# Altium schematic sheet Top_Sheet.SchDoc
size A4; DocumentNumber: 1; SheetNumber: 1; SheetTotal: 5
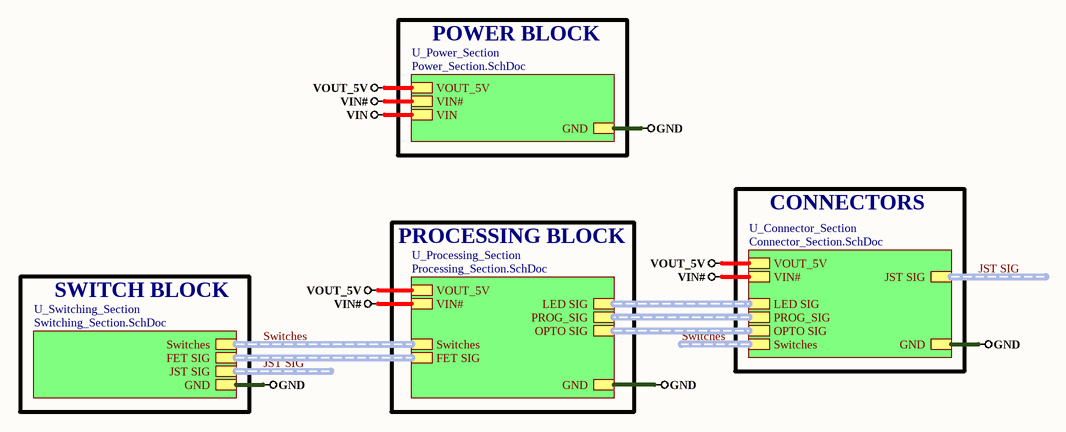
[diagram p0: Top_Sheet.SchDoc]

## Sub-sheets
U_Connector_Section = Connector_Section.SchDoc: VOUT_5V, GND, VIN#, PROG_SIG (harness PROG_SIG), LED SIG (harness LED SIG), Switches (harness Switches), OPTO SIG (harness OPTO SIG), JST SIG (harness JST SIG)
U_Power_Section = Power_Section.SchDoc: VOUT_5V, GND, VIN#, VIN
U_Processing_Section = Processing_Section.SchDoc: Switches (harness Switches), LED SIG (harness LED SIG), PROG_SIG (harness PROG_SIG), VOUT_5V, VIN#, FET SIG (harness FET SIG), OPTO SIG (harness OPTO SIG), GND
U_Switching_Section = Switching_Section.SchDoc: FET SIG (harness FET SIG), Switches (harness Switches), GND, JST SIG (harness JST SIG)

## Nets
GND: sheet U_Connector_Section/GND, sheet U_Processing_Section/GND, sheet U_Switching_Section/GND, sheet U_Power_Section/GND
VIN: sheet U_Power_Section/VIN
VIN#: sheet U_Connector_Section/VIN#, sheet U_Processing_Section/VIN#, sheet U_Power_Section/VIN#
VOUT_5V: sheet U_Connector_Section/VOUT_5V, sheet U_Processing_Section/VOUT_5V, sheet U_Power_Section/VOUT_5V

## Buses and harness runs
harness JST SIG = sheet U_Connector_Section/JST SIG
harness JST SIG = sheet U_Switching_Section/JST SIG
harness sheet U_Connector_Section/LED SIG = sheet U_Processing_Section/LED SIG
harness sheet U_Connector_Section/OPTO SIG = sheet U_Processing_Section/OPTO SIG
harness sheet U_Connector_Section/PROG_SIG = sheet U_Processing_Section/PROG_SIG
harness sheet U_Processing_Section/FET SIG = sheet U_Switching_Section/FET SIG
harness Switches = sheet U_Connector_Section/Switches
harness Switches = sheet U_Processing_Section/Switches = sheet U_Switching_Section/Switches

## Notes on the sheet
- POWER BLOCK
- CONNECTORS
- PROCESSING BLOCK
- SWITCH BLOCK